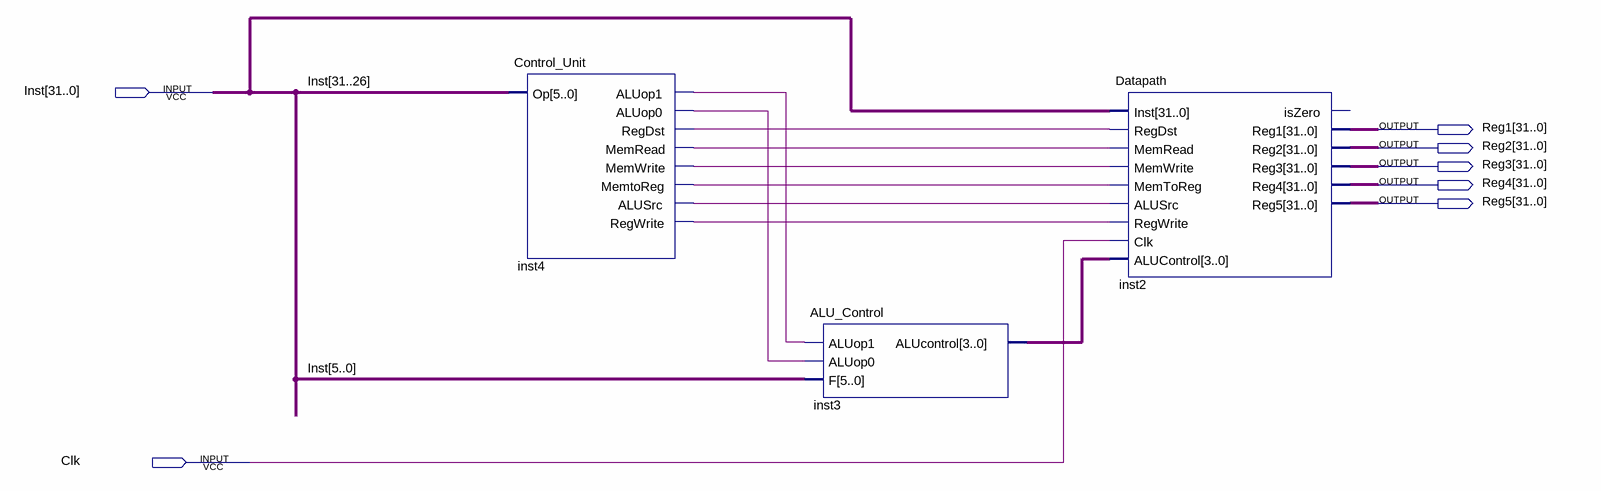
[diagram p0: schematic sheet]
// Quartus schematic cau01.bdf as structural Verilog: 3 symbols, 7 pins
module cau01 (
  input  [31:0] Inst,
  input  Clk,
  output [31:0] Reg1,
  output [31:0] Reg2,
  output [31:0] Reg3,
  output [31:0] Reg4,
  output [31:0] Reg5
);

  wire inst4_aluop0, inst4_aluop1, inst4_alusrc, inst4_memread, inst4_memtoreg, inst4_memwrite, inst4_regdst,
       inst4_regwrite;
  wire [3:0] inst3_alucontrol;

  Control_Unit inst4 (
    .Op(Inst[31:26]), .ALUop1(inst4_aluop1), .ALUop0(inst4_aluop0), .RegDst(inst4_regdst),
    .MemRead(inst4_memread), .MemWrite(inst4_memwrite), .MemtoReg(inst4_memtoreg), .ALUSrc(inst4_alusrc),
    .RegWrite(inst4_regwrite));
  ALU_Control inst3 (.ALUop1(inst4_aluop1), .ALUop0(inst4_aluop0), .F(Inst[5:0]), .ALUcontrol(inst3_alucontrol));
  Datapath inst2 (
    .MemRead(inst4_memread), .RegWrite(inst4_regwrite), .ALUSrc(inst4_alusrc), .ALUControl(inst3_alucontrol),
    .RegDst(inst4_regdst), .MemWrite(inst4_memwrite), .MemToReg(inst4_memtoreg), .Inst(Inst), .Clk(Clk),
    .Reg1(Reg1), .Reg2(Reg2), .Reg3(Reg3), .Reg4(Reg4), .Reg5(Reg5));  // open: isZero
endmodule
